# EAGLE design JSDM ESP32 Devkit DS3231 3x HUB12 Single (EAGLE 7.7.0)
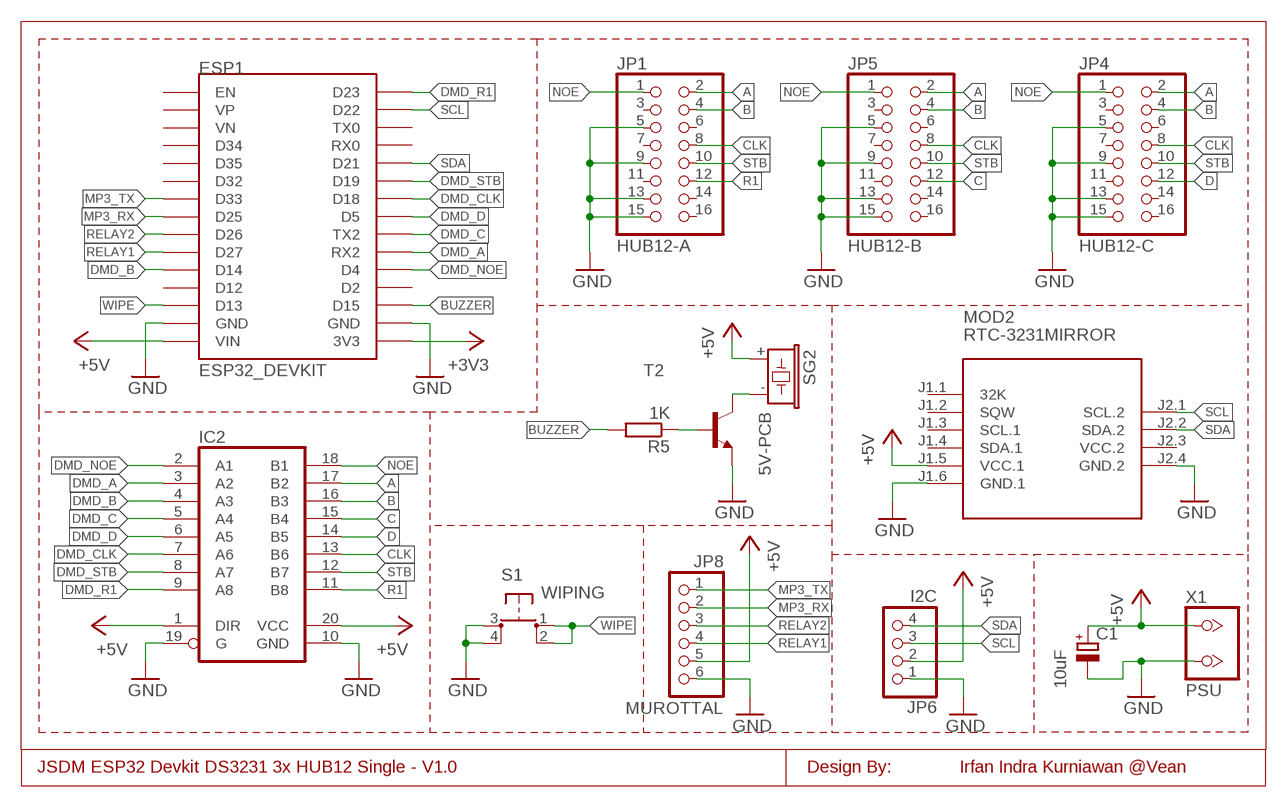
[diagram p0: schematic, sheet 1]

## Parts
C1  10uF  CPOL-EUE3.5-8  [E3,5-8]
ESP1  ESP32_DEVKIT  [ESP32_DEVKIT]
IC2  74245SMD  [SO20]
JP1  HUB12-A  PINHD-2X8  [2X08]
JP4  HUB12-C  PINHD-2X8  [2X08]
JP5  HUB12-B  PINHD-2X8  [2X08]
JP6  I2C  PINHD-1X4  [1X04]
JP8  MUROTTAL  PINHD-1X6  [1X06]
MOD2  RTC-3231MIRROR  [RTC-DS3231-MIRROR]
R5  1K  R-EU_0207/7  [0207/7]
S1  WIPING  TACT-6X6OCT  [TACT-6X6MM-OCTAGON]
SG2  5V-PCB  [5V]
T2  BC317-NPN-TO92-EBC  [TO92-EBC]
X1  PSU  2PIN  [TB2]

## Nets
+3V3: ESP1.3V3
+5V: C1.+ ESP1.VIN IC2.1(DIR) IC2.20(VCC) JP6.2 JP8.5 MOD2.J1.5(VCC.1) SG2.+ X1.1
A: IC2.17(B2) JP1.2 JP4.2 JP5.2
B: IC2.16(B3) JP1.4 JP4.4 JP5.4
BUZZER: ESP1.D15 R5.2
C: IC2.15(B4) JP5.12
CLK: IC2.13(B6) JP1.8 JP4.8 JP5.8
D: IC2.14(B5) JP4.12
DMD_A: ESP1.RX2 IC2.3(A2)
DMD_B: ESP1.D14 IC2.4(A3)
DMD_C: ESP1.TX2 IC2.5(A4)
DMD_CLK: ESP1.D18 IC2.7(A6)
DMD_D: ESP1.D5 IC2.6(A5)
DMD_NOE: ESP1.D4 IC2.2(A1)
DMD_R1: ESP1.D23 IC2.9(A8)
DMD_STB: ESP1.D19 IC2.8(A7)
GND: C1.- ESP1.GND@1(GND) ESP1.GND@2(GND) IC2.10(GND) IC2.19(G) JP1.5 JP1.9 JP1.13 JP1.15 JP4.5 JP4.9 JP4.13 JP4.15 JP5.5 JP5.9 JP5.13 JP5.15 JP6.1 JP8.6 MOD2.J1.6(GND.1) MOD2.J2.4(GND.2) S1.3(P) S1.4(P1) T2.E X1.2
MP3_RX: ESP1.D25 JP8.2
MP3_TX: ESP1.D33 JP8.1
N$1: SG2.- T2.C
N$4: R5.1 T2.B
NOE: IC2.18(B1) JP1.1 JP4.1 JP5.1
R1: IC2.11(B8) JP1.12
RELAY1: ESP1.D27 JP8.4
RELAY2: ESP1.D26 JP8.3
SCL: ESP1.D22 JP6.3 MOD2.J2.1(SCL.2)
SDA: ESP1.D21 JP6.4 MOD2.J2.2(SDA.2)
STB: IC2.12(B7) JP1.10 JP4.10 JP5.10
WIPE: ESP1.D13 S1.1(S) S1.2(S1)
Unconnected: ESP1.D2 ESP1.D12 ESP1.D32 ESP1.D34 ESP1.D35 ESP1.EN ESP1.RX0 ESP1.TX0 ESP1.VN ESP1.VP JP1.3 JP1.6 JP1.7 JP1.11 JP1.14 JP1.16 JP4.3 JP4.6 JP4.7 JP4.11 JP4.14 JP4.16 JP5.3 JP5.6 JP5.7 JP5.11 JP5.14 JP5.16 MOD2.J1.1(32K) MOD2.J1.2(SQW) MOD2.J1.3(SCL.1) MOD2.J1.4(SDA.1)

## Notes on the sheet
- JSDM ESP32 Devkit DS3231 3x HUB12 Single - V1.0 | Design By: | Irfan Indra Kurniawan @Vean

## Power pins joined to a net without a drawn wire
VCC.2: MOD2.J2.3(VCC.2)

## Library data of the parts
C1 = FansElectronics-RCL:CPOL-EU: POLARIZED CAPACITOR, European symbol
ESP1 = DOIT_ESP32_DEVKIT:ESP32_DEVKIT: ESP32 DEVKIT BOARD
IC2 = FansElectronics-IC-74xx:74*245
JP1 JP4 JP5 = FansElectronics-Header:PINHD-2X8: PIN HEADER
JP6 = FansElectronics-Header:PINHD-1X4: PIN HEADER
JP8 = FansElectronics-Header:PINHD-1X6: PIN HEADER
MOD2 = FansElectronics-Modul:RTC-3231
R5 = FansElectronics-RCL:R-EU_: RESISTOR, European symbol
S1 = FansElectronics-Switch:TACT: TACT SWITCH biasa juga disebut Switch Omron / Micro Switch
SG2 = FansElectronics-Buzzer:5V-PCB: Buzzer 5V on PCB
T2 = transistor:*-NPN-: NPN Transistror BF959 corrected 2008.03.06
X1 = FansElectronics-Con-Screw:2PIN

## Board
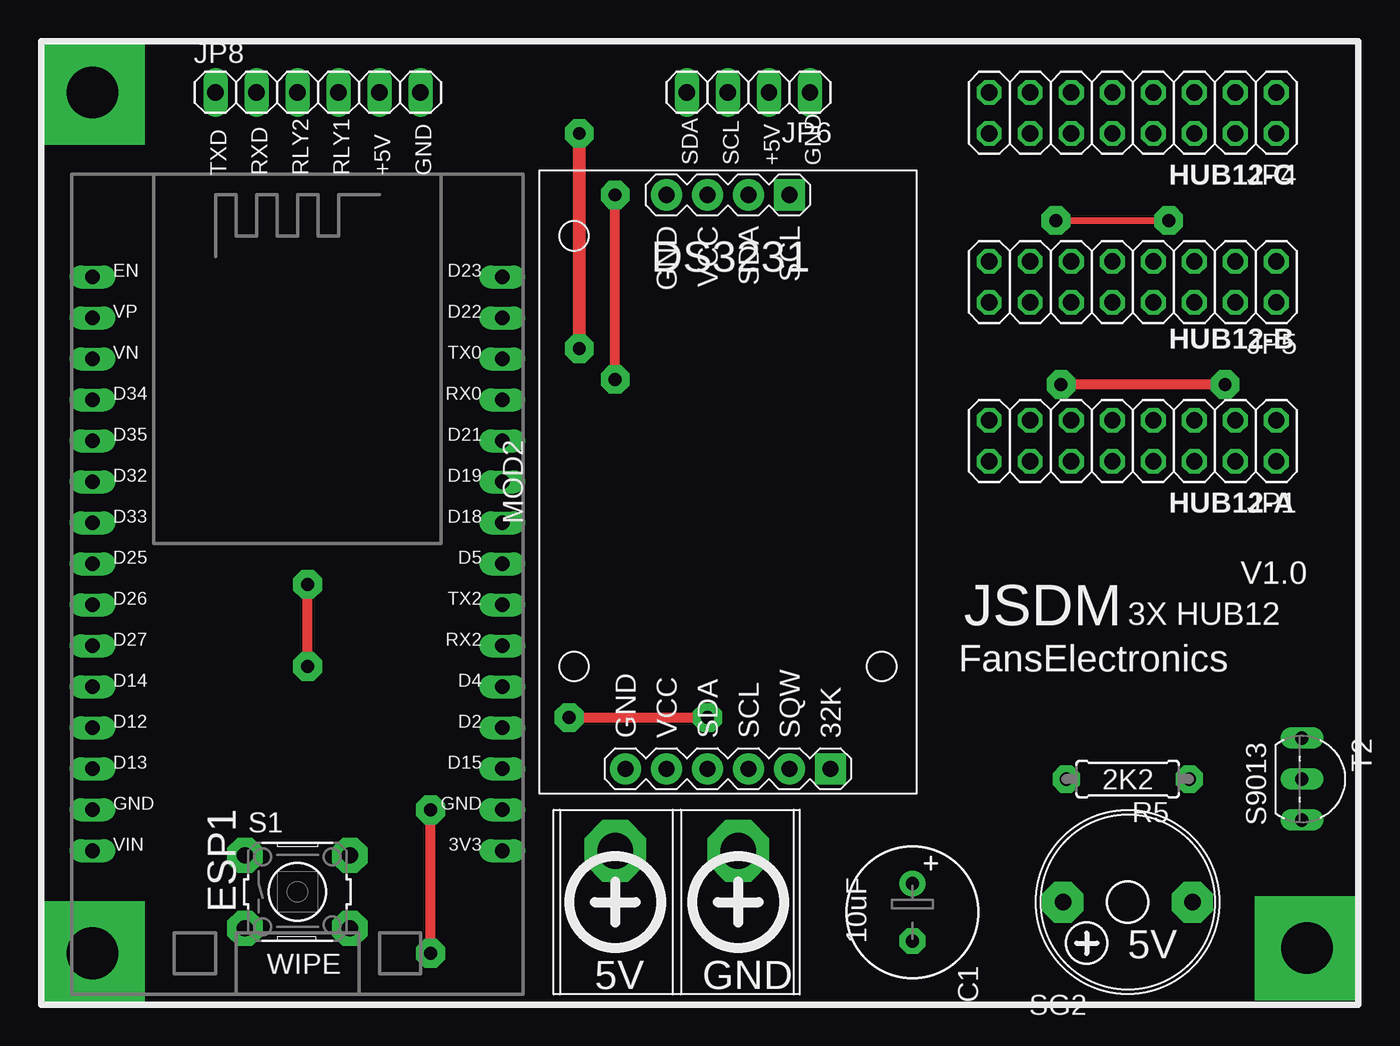
[diagram p1: board, top side]
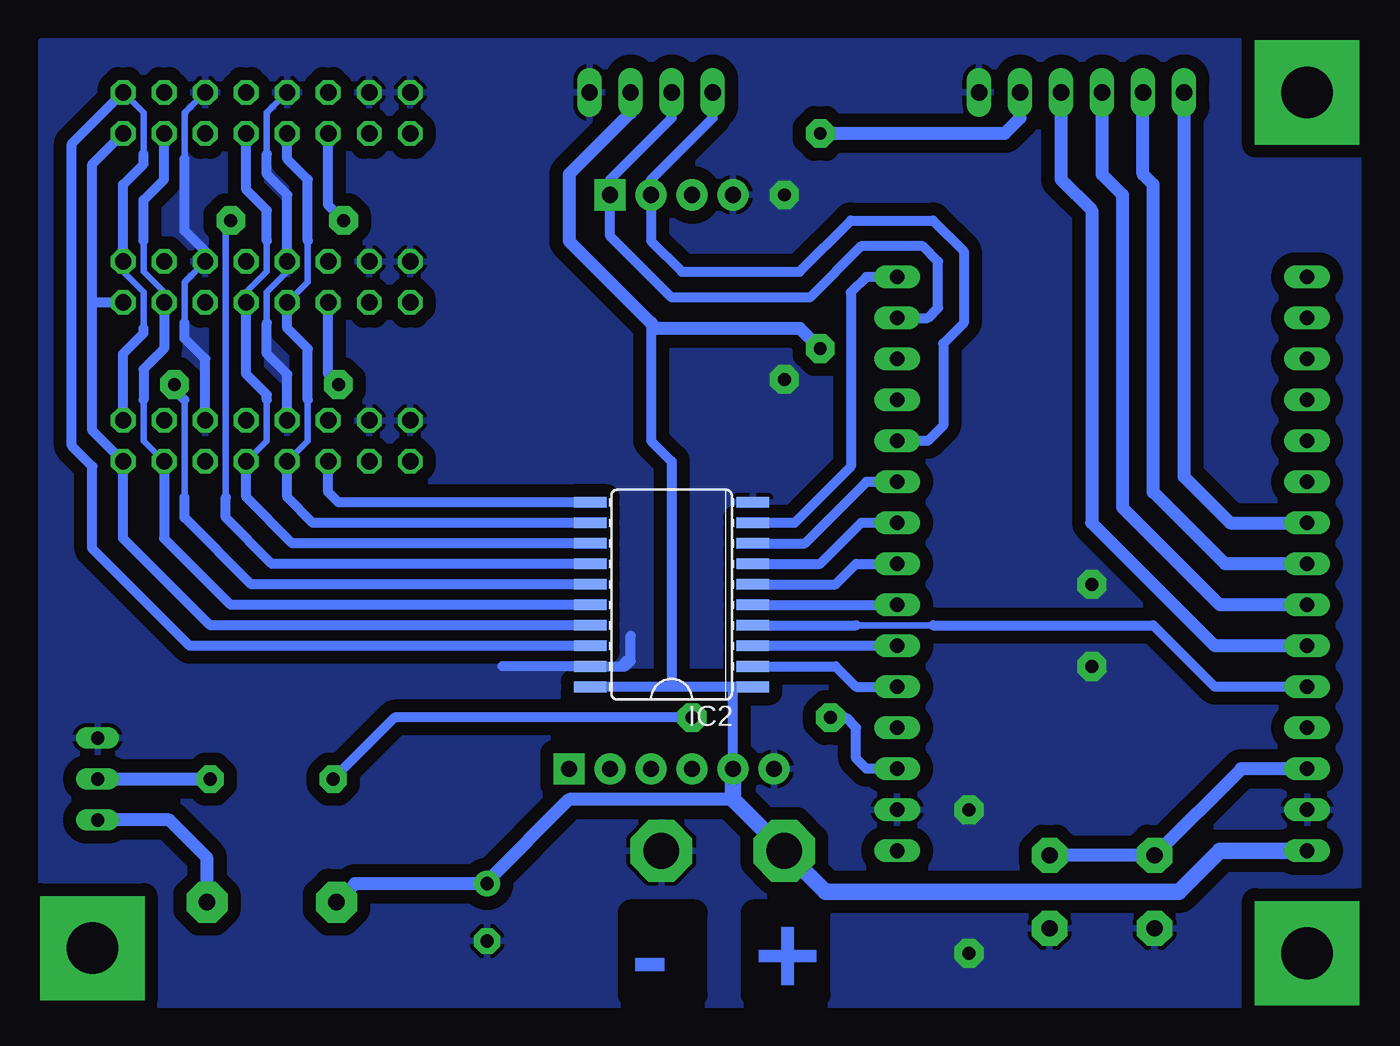
[diagram p2: board, bottom side, seen from below]

No outline drawn. Coordinates in mm, seen from the top.
Copper layers (1*16): Top 0.035mm / dielectric 1.5mm / Bottom 0.035mm
Design rules "default": minimum track width 10mil, minimum drill 24mil, track to track 8mil, track to pad 8mil, pad to pad 8mil, via to via 8mil, smd to smd 8mil, copper to edge 40mil, drill to drill 8mil, minimum pad ring 10mil, minimum via ring 8mil, stop-mask expansion 4mil, vias tented up to drill 0mil, thermal gap 10mil

### Footprints (pad centres in the part's own frame; a part is rotated, then mirrored left to right if it is on the bottom)
E3,5-8 = drill 0.813 pad 1.6: + -1.778,0 | drill 0.813 pad 1.6 octagon: - 1.778,0
ESP32_DEVKIT = drill 0.9 pad 1.422 long: 3V3 11.43,-17.78; D2 11.43,-10.16; D4 11.43,-7.62; D5 11.43,0; D12 -13.97,-10.16; D13 -13.97,-12.7; D14 -13.97,-7.62; D15 11.43,-12.7; D18 11.43,2.54; D19 11.43,5.08; D21 11.43,7.62; D22 11.43,15.24; D23 11.43,17.78; D25 -13.97,0; D26 -13.97,-2.54; D27 -13.97,-5.08; D32 -13.97,5.08; D33 -13.97,2.54; D34 -13.97,10.16; D35 -13.97,7.62; EN -13.97,17.78; GND@1 -13.97,-15.24; GND@2 11.43,-15.24; RX0 11.43,10.16; RX2 11.43,-5.08; TX0 11.43,12.7; TX2 11.43,-2.54; VIN -13.97,-17.78; VN -13.97,12.7; VP -13.97,15.24
SO20 = smd 0.66 x 2.032: 1 -5.715,-5.029; 2 -4.445,-5.029; 3 -3.175,-5.029; 4 -1.905,-5.029; 5 -0.635,-5.029; 6 0.635,-5.029; 7 1.905,-5.029; 8 3.175,-5.029; 9 4.445,-5.029; 10 5.715,-5.029; 11 5.715,5.029; 12 4.445,5.029; 13 3.175,5.029; 14 1.905,5.029; 15 0.635,5.029; 16 -0.635,5.029; 17 -1.905,5.029; 18 -3.175,5.029; 19 -4.445,5.029; 20 -5.715,5.029
2X08 = drill 1.016 octagon: 1 -8.89,-1.27; 2 -8.89,1.27; 3 -6.35,-1.27; 4 -6.35,1.27; 5 -3.81,-1.27; 6 -3.81,1.27; 7 -1.27,-1.27; 8 -1.27,1.27; 9 1.27,-1.27; 10 1.27,1.27; 11 3.81,-1.27; 12 3.81,1.27; 13 6.35,-1.27; 14 6.35,1.27; 15 8.89,-1.27; 16 8.89,1.27
1X04 = drill 1.016 long: 1 -3.81,0; 2 -1.27,0; 3 1.27,0; 4 3.81,0
1X06 = drill 1.016 long: 1 -6.35,0; 2 -3.81,0; 3 -1.27,0; 4 1.27,0; 5 3.81,0; 6 6.35,0
RTC-DS3231-MIRROR = drill 1 pad 1.93 square: J1.1 -17.78,-6.35; J2.1 17.78,-3.81 | drill 1 pad 1.93: J1.2 -17.78,-3.81; J1.3 -17.78,-1.27; J1.4 -17.78,1.27; J1.5 -17.78,3.81; J1.6 -17.78,6.35; J2.2 17.78,-1.27; J2.3 17.78,1.27; J2.4 17.78,3.81
0207/7 = drill 0.813 pad 1.676 octagon: 1 -3.81,0; 2 3.81,0
TACT-6X6MM-OCTAGON = drill 1.016 pad 2.184 octagon: 1 -3.251,2.261; 2 3.251,2.261; 3 -3.251,-2.261; 4 3.251,-2.261
5V = drill 1.016 pad 2.54 octagon: + 4.01,0; - -4.01,0
TO92-EBC = drill 0.813 long: B 0,-1.27; C 2.54,-1.27; E -2.54,-1.27
TB2 = drill 2.2 pad 3.81 octagon: 1 -3.81,0; 2 3.81,0

### Placement (x,y rotation side)
C1  78.74,25.4 270 top
ESP1  41.91,46.99 0 top
IC2  67.31,45.09 90 bottom
JP1  92.39,54.61 180 top
JP4  92.39,74.93 180 top
JP5  92.39,64.45 180 top
JP6  68.58,76.2 180 top
JP8  41.91,76.2 0 top
MOD2  67.31,52.07 90 top
R5  92.08,33.66 180 top
S1  40.64,26.67 0 top
SG2  92.08,26.04 180 top
T2  104.14,33.66 270 top
X1  64.14,29.21 0 top

### Tracks (layer width: path | path; a pad name or v marks a point on that pad's centre or on a via)
+5V  (via drill 0.8 pad 1.78)
  Top 0.813: v58.1,60.33 v58.1,73.66
  Bottom 0.61: MOD2.J1.5 63.5,39.37 IC2.1 67.31,39.37 | 67.31,39.37 IC2.20 | 68.58,61.91 68.58,54.61 67.31,53.34 67.31,39.37
  Bottom 0.813: JP6.2 69.85,74.93 73.66,71.12 73.66,66.99 68.58,61.91 68.26,61.59 59.37,61.59 v58.1,60.33 | v58.1,73.66 46.67,73.66 45.72,74.61 JP8.5 | 63.5,32.38 73.66,32.38 78.74,27.3 78.61,27.3 C1.+ 86.92,27.18 SG2.+
  Bottom 1.016: ESP1.VIN 33.34,29.21 35.88,26.67 57.78,26.67 X1.1 63.5,32.38 MOD2.J1.5
A
  Bottom 0.61: 103.19,63.18 103.19,71.75 JP4.2 | JP5.2 103.19,63.18 | IC2.17 95.89,43.18 101.28,48.58 JP1.2 103.19,55.24 103.19,63.18
B
  Bottom 0.406: JP5.4 98.74,63.82 100.01,65.09 100.01,66.99 | 100.01,57.15 100.01,54.61 JP1.4
  Bottom 0.61: 100.01,66.99 100.01,69.53 98.74,70.8 JP4.4 | JP1.4 98.74,48.58 94.61,44.45 IC2.16 | JP5.4 98.74,60.33 100.01,59.05 100.01,57.15
BUZZER  (via drill 0.8 pad 1.78)
  Top 0.61: v57.47,37.47 v66.04,37.47
  Bottom 0.61: ESP1.D15 55.24,34.29 55.88,34.92 55.88,36.83 56.52,37.47 v57.47,37.47 | v66.04,37.47 84.45,37.47 R5.2
C  (via drill 0.8 pad 1.78)
  Top 0.61: v98.11,58.1 v87.95,58.1
  Bottom 0.406: 97.47,51.12 97.47,57.15
  Bottom 0.61: IC2.15 93.34,45.72 97.47,49.85 97.47,51.12 | 97.47,57.15 98.11,57.78 v98.11,58.1 | v87.95,58.1 88.58,58.74 JP5.12
CLK
  Bottom 0.406: JP1.8 92.39,54.61 92.39,57.15 | JP5.8 93.66,63.82 92.39,65.09 92.39,66.99
  Bottom 0.61: IC2.13 90.81,48.26 93.66,51.12 JP1.8 | 92.39,57.15 92.39,57.47 93.66,58.74 JP5.8 | 92.39,66.99 92.39,68.9 93.66,70.17 JP4.8
D  (via drill 0.8 pad 1.78)
  Top 0.406: v94.61,68.26 v87.63,68.26
  Bottom 0.406: 94.93,51.12 94.93,67.94 v94.61,68.26
  Bottom 0.61: IC2.14 92.08,46.99 94.93,49.85 94.93,51.12 | v87.63,68.26 88.58,69.22 JP4.12
DMD_A
  Bottom 0.61: ESP1.RX2 IC2.3
DMD_B
  Bottom 0.406: 55.88,43.18 51.12,43.18
  Bottom 0.61: IC2.4 55.88,43.18 | 51.12,43.18 37.47,43.18 33.66,39.37 ESP1.D14
DMD_C
  Bottom 0.61: IC2.5 ESP1.TX2
DMD_CLK
  Bottom 0.61: IC2.7 58.1,46.99 55.56,49.53 ESP1.D18
DMD_D
  Bottom 0.61: IC2.6 57.15,45.72 55.88,46.99 ESP1.D5
DMD_NOE
  Bottom 0.61: IC2.2 57.15,40.64 55.88,39.37 ESP1.D4
DMD_R1
  Bottom 0.61: ESP1.D23 55.24,64.77 56.2,63.82 56.2,53.02 59.69,49.53 IC2.9
DMD_STB
  Bottom 0.61: IC2.8 59.05,48.26 55.24,52.07 ESP1.D19
GND  (via drill 0.8 pad 1.78)
  Top 0.61: v60.33,58.42 v60.33,69.85 | v48.9,22.86 v48.9,31.75 | v41.27,40.64 v41.27,45.72
  Bottom 0.406: 97.47,61.91 97.47,64.45 JP5.5 | 92.39,61.91 92.39,63.82 91.12,65.09 JP5.9 | 92.39,72.39 92.39,74.93 JP4.9 | 97.47,72.07 97.47,74.93 JP4.5
  Bottom 0.61: 70.48,40.64 IC2.19 77.79,40.64 | 70.48,40.64 70.17,40.64 69.85,40.96 | 69.85,40.96 69.85,42.55 | 69.85,40.96 70.17,40.96 70.48,40.64 | JP1.5 96.2,59.69 97.47,60.96 97.47,61.91 | JP1.9 91.12,58.74 92.39,60.01 92.39,61.91 | JP5.9 91.12,69.85 92.39,71.12 92.39,72.39 | JP5.5 96.2,66.36 97.47,67.63 97.47,72.07
  pour Bottom (isolate 0.813): 24.77,19.68 106.36,19.68 106.36,79.38 24.77,79.38
MP3_RX
  Bottom 0.813: ESP1.D25 33.02,46.99 37.47,51.44 37.47,70.48 38.1,71.12 JP8.2
MP3_TX
  Bottom 0.813: JP8.1 35.56,52.39 32.7,49.53 ESP1.D33
N$1
  Bottom 0.813: SG2.- 96.08,28.77 98.42,31.11 T2.C
N$2  (via drill 3.2 pad 6.45)
  other vias: 27.94,76.2
N$3  (via drill 3.2 pad 6.45)
  other vias: 27.94,22.86
N$4
  Bottom 0.813: T2.B R5.1
N$5  (via drill 3.2 pad 6.45)
  other vias: 103.19,23.18
NOE
  Bottom 0.406: 100.01,72.39 100.01,74.93 JP4.1 | 100.01,61.59 100.01,63.82 101.28,65.09 JP5.1
  Bottom 0.61: JP4.1 104.46,73.03 104.46,54.29 103.19,53.02 103.19,47.94 97.16,41.91 IC2.18 | JP5.1 101.28,70.48 100.01,71.75 100.01,72.39 | JP1.1 101.28,60.01 100.01,61.28 100.01,61.59
R1
  Bottom 0.61: IC2.11 87.95,50.8 88.58,51.44 JP1.12
RELAY1
  Bottom 0.813: JP8.4 43.18,70.8 41.27,68.9 41.27,49.53 33.66,41.91 ESP1.D27
RELAY2
  Bottom 0.813: JP8.3 40.64,71.12 39.37,69.85 39.37,50.48 33.34,44.45 ESP1.D26
SCL
  Bottom 0.61: ESP1.D22 51.44,62.23 50.8,62.87 50.8,65.72 51.75,66.67 55.56,66.67 58.74,63.5 67.31,63.5 71.12,67.31 MOD2.J2.1 71.12,70.8 67.31,74.61 JP6.3
SDA
  Bottom 0.61: ESP1.D21 51.44,54.61 50.48,55.56 50.48,60.64 49.21,61.91 49.21,66.36 51.12,68.26 56.2,68.26 59.37,65.09 66.67,65.09 68.58,66.99 MOD2.J2.2 68.58,70.8 64.77,74.61 JP6.4
STB
  Bottom 0.406: JP1.10 89.85,54.61 89.85,57.15 | JP5.10 89.85,64.45 89.85,66.99
  Bottom 0.61: IC2.12 89.53,49.53 91.12,51.12 JP1.10 | JP5.10 91.12,61.59 89.85,60.33 89.85,57.15 | 89.85,66.99 89.85,70.8 91.12,72.07 JP4.10
WIPE
  Bottom 0.813: ESP1.D13 32.03,34.29 S1.1 S1.2

### Text on the board
Bottom: + | -
tPlace: SDA | SCL | +5V | GND | TXD | RXD | RLY2 | RLY1 | +5V | GND | HUB12-C | DS3231 | HUB12-B | HUB12-A | V1.0 | JSDM | 3X HUB12 | FansElectronics | 2K2 | S9013 | 10uF | 5V | WIPE | 5V | GND